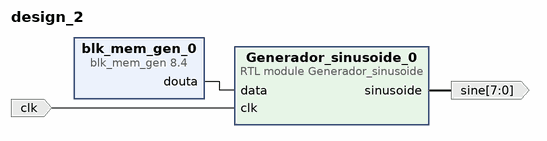
[diagram p0: block diagram of the top level]
# Vivado block design design_2, xc7a35tcpg236-1, Vivado 2020.1
create_bd_design design_2

create_bd_port -dir O -from 7 -to 0 sine
create_bd_port -dir I -type clk clk

create_bd_cell -type ip -vlnv xilinx.com:ip:blk_mem_gen:8.4 blk_mem_gen_0
set_property -dict [list \
  CONFIG.Coe_File ../../../../../../../quartersine.coe \
  CONFIG.Enable_32bit_Address false \
  CONFIG.Enable_A Always_Enabled \
  CONFIG.Load_Init_File true \
  CONFIG.Memory_Type Single_Port_ROM \
  CONFIG.Port_A_Write_Rate 0 \
  CONFIG.Register_PortA_Output_of_Memory_Primitives true \
  CONFIG.Use_RSTA_Pin false \
  CONFIG.Write_Depth_A 128 \
  CONFIG.Write_Width_A 8 \
  CONFIG.use_bram_block Stand_Alone \
] [get_bd_cells blk_mem_gen_0]
create_bd_cell -type module -reference Generador_sinusoide Generador_sinusoide_0

# ---- connections ----

connect_bd_net [get_bd_pins blk_mem_gen_0/douta] [get_bd_pins Generador_sinusoide_0/data]
connect_bd_net [get_bd_pins Generador_sinusoide_0/sinusoide] [get_bd_ports sine]
connect_bd_net -net clk_0_1 [get_bd_ports clk] [get_bd_pins Generador_sinusoide_0/clk]

validate_bd_design
save_bd_design
